# Altium schematic sheet 02_Nucleo_1.SchDoc: 02_Nucleo_1.SchDoc
size Letter; Author: Miguel Donis; Organization: Altium Limited; Address1: L3, 12a Rodborough Rd; Address2: Frenchs Forest; Address3: NSW; Address4: Australia 2086; Revision: 1.0; SheetNumber: 2; SheetTotal: 5; Carnet: 22993; Curso: Digital 2; ProjectName: proyecto 3
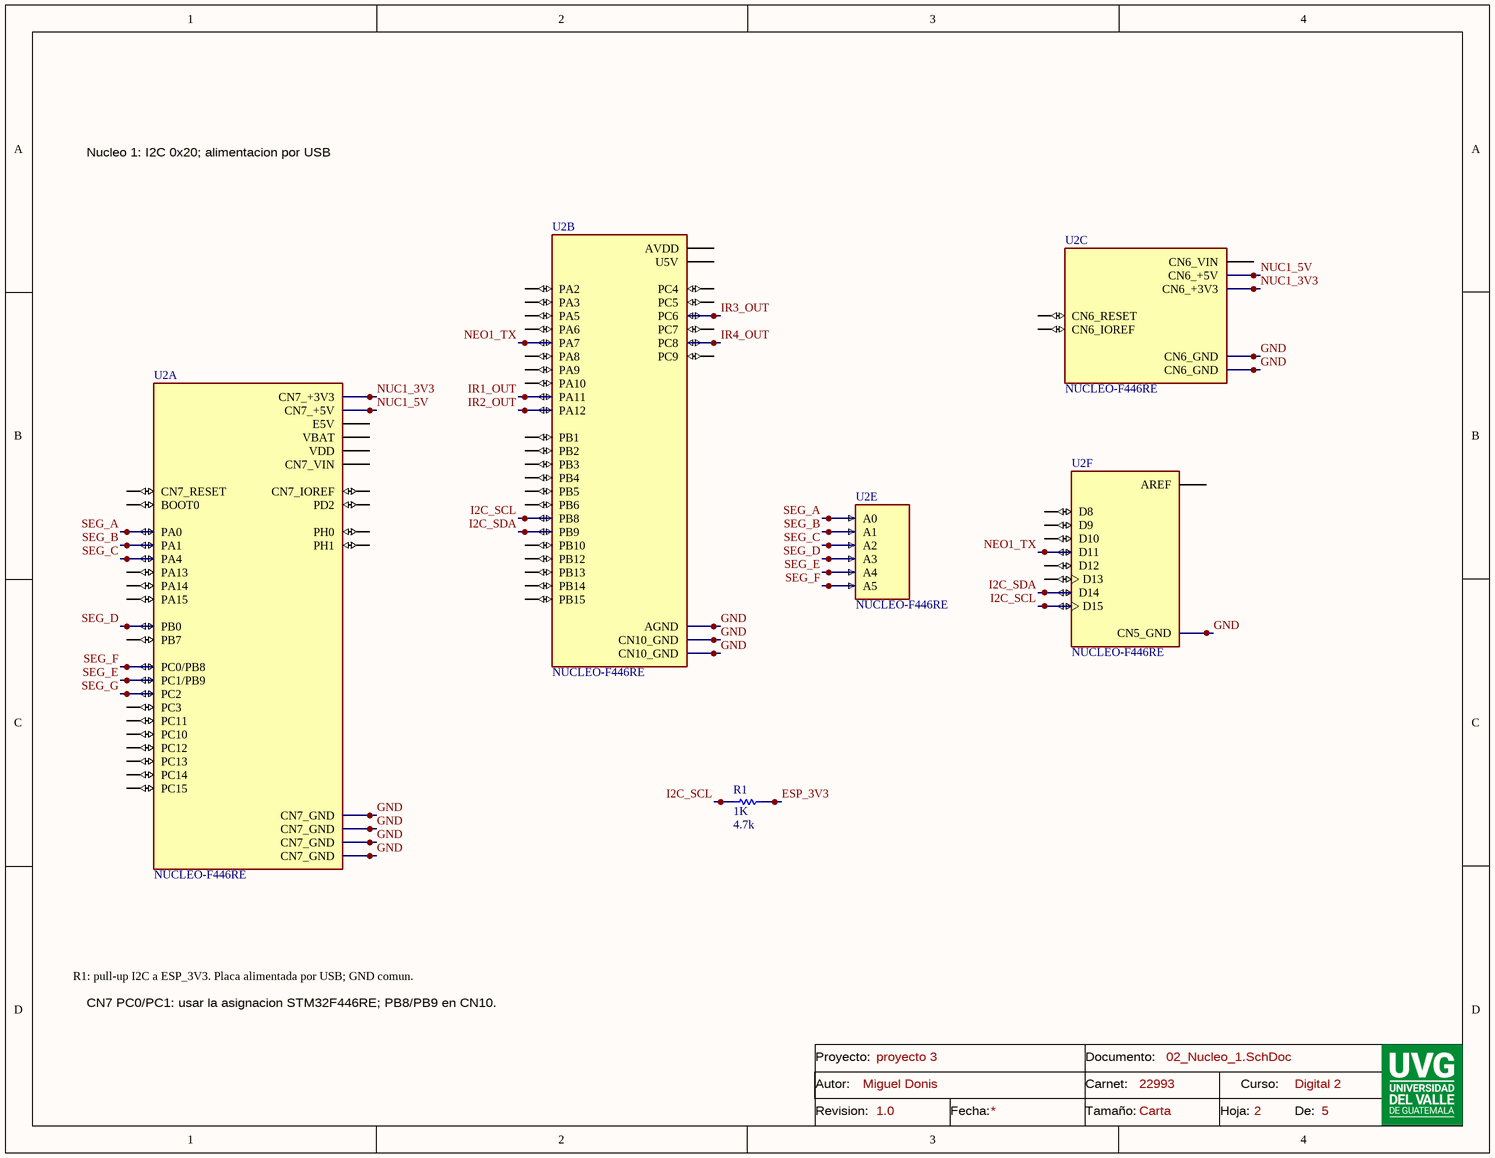
[diagram p0: 02_Nucleo_1.SchDoc]

## Parts
R1  4.7k  value 1K  [AXIAL-0.3]
U2  NUCLEO-F446RE  [MODULE_NUCLEO-F446RE]  (parts A,B,C,E,F of 6)

## Nets
ESP_3V3: R1.2
GND: U2.CN5_7(CN5_GND) U2.CN6_6(CN6_GND) U2.CN6_7(CN6_GND) U2.CN7_8(CN7_GND) U2.CN7_19(CN7_GND) U2.CN7_20(CN7_GND) U2.CN7_22(CN7_GND) U2.CN10_9(CN10_GND) U2.CN10_20(CN10_GND) U2.CN10_32(AGND)
I2C_SCL: R1.1 U2.CN5_10(D15) U2.CN10_3(PB8)
I2C_SDA: U2.CN5_9(D14) U2.CN10_5(PB9)
IR1_OUT: U2.CN10_14(PA11)
IR2_OUT: U2.CN10_12(PA12)
IR3_OUT: U2.CN10_4(PC6)
IR4_OUT: U2.CN10_2(PC8)
NEO1_TX: U2.CN5_4(D11) U2.CN10_15(PA7)
NUC1_3V3: U2.CN6_4(CN6_+3V3) U2.CN7_16(CN7_+3V3)
NUC1_5V: U2.CN6_5(CN6_+5V) U2.CN7_18(CN7_+5V)
SEG_A: U2.CN7_28(PA0) U2.CN8_1(A0)
SEG_B: U2.CN7_30(PA1) U2.CN8_2(A1)
SEG_C: U2.CN7_32(PA4) U2.CN8_3(A2)
SEG_D: U2.CN7_34(PB0) U2.CN8_4(A3)
SEG_E: U2.CN7_36(PC1/PB9) U2.CN8_5(A4)
SEG_F: U2.CN7_38(PC0/PB8) U2.CN8_6(A5)
SEG_G: U2.CN7_35(PC2)

Not connected (* = marked no-connect by the designer): U2 CN5_1(D8) CN5_2(D9) CN5_3(D10) CN5_5(D12) CN5_6(D13) CN5_8(AREF) CN6_2(CN6_IOREF) CN6_3(CN6_RESET) CN6_8(CN6_VIN) CN7_1(PC10) CN7_2(PC11) CN7_3(PC12) CN7_4(PD2) CN7_5(VDD) CN7_6(E5V) CN7_7(BOOT0) CN7_12(CN7_IOREF) CN7_13(PA13) CN7_14(CN7_RESET) CN7_15(PA14) CN7_17(PA15) CN7_21(PB7) CN7_23(PC13) CN7_24(CN7_VIN) CN7_25(PC14) CN7_27(PC15) CN7_29(PH0) CN7_31(PH1) CN7_33(VBAT) CN7_37(PC3) CN10_1(PC9) CN10_6(PC5) CN10_7(AVDD) CN10_8(U5V) CN10_11(PA5) CN10_13(PA6) CN10_16(PB12) CN10_17(PB6) CN10_19(PC7) CN10_21(PA9) CN10_22(PB2) CN10_23(PA8) CN10_24(PB1) CN10_25(PB10) CN10_26(PB15) CN10_27(PB4) CN10_28(PB14) CN10_29(PB5) CN10_30(PB13) CN10_31(PB3) CN10_33(PA10) CN10_34(PC4) CN10_35(PA2) CN10_37(PA3)

## Notes on the sheet
- Nucleo 1: I2C 0x20; alimentacion por USB
- R1: pull-up I2C a ESP_3V3. Placa alimentada por USB; GND comun.
- CN7 PC0/PC1: usar la asignacion STM32F446RE; PB8/PB9 en CN10.
- Proyecto:
- Autor:
- Documento:
- Carnet:
- Curso:
- Revision:
- Fecha:
- Tamaño:
- Carta
- Hoja:
- De:

## Library data of the parts
R1 = Res1: Resistor; Published: 8-Jun-2000; LatestRevisionDate: 17-Jul-2002; LatestRevisionNote: Re-released for DXP Platform.; PackageReference: AXIAL-0.3; Publisher: Altium Limited; PackageDescription: Axial Device, Thru-Hole; 2 Leads; 0.3 in Pin Spacing
U2 = NUCLEO-F446RE: STM32F446RE, mbed-Enabled Development Nucleo-64 STM32F4 ARMÂ® CortexÂ®-M4 MCU 32-Bit Embedded Evaluation Board; MF: STMicroelectronics; SnapEDA_Link: https://www.snapeda.com/parts/NUCLEO-F446RE/STMicroelectronics/view-part/?ref=snap; Package: None; Value: *; MP: NUCLEO-F446RE; Check_prices: https://www.snapeda.com/parts/NUCLEO-F446RE/STMicroelectronics/view-part/?ref=eda